# Altium schematic sheet Top-Sheet.SchDoc
size A4; SheetNumber: 1; SheetTotal: 6
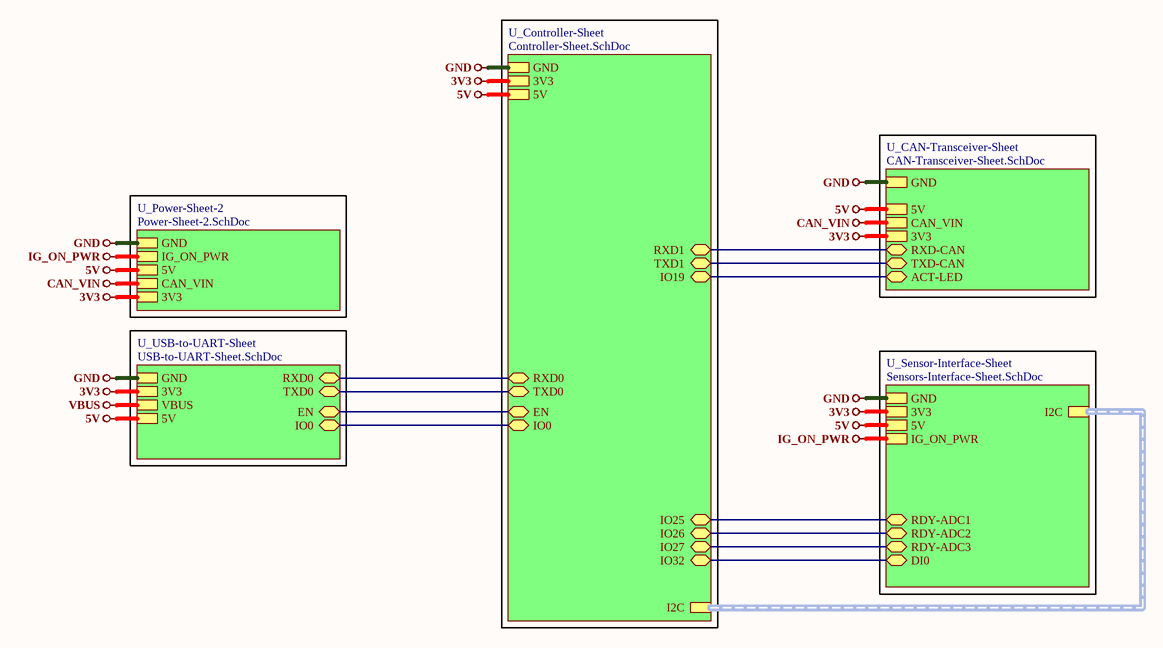
[diagram p0: Top-Sheet.SchDoc]

## Sub-sheets
U_CAN-Transceiver-Sheet = CAN-Transceiver-Sheet.SchDoc: GND, 3V3, CAN_VIN, RXD-CAN (bidir), TXD-CAN (bidir), ACT-LED (bidir), 5V
U_Controller-Sheet = Controller-Sheet.SchDoc: I2C (harness I2C), GND, 3V3, TXD0 (bidir), RXD0 (bidir), EN (bidir), IO0 (bidir), TXD1 (bidir), RXD1 (bidir), IO25 (bidir), IO26 (bidir), IO27 (bidir), IO19 (bidir), IO32 (bidir), 5V
U_Power-Sheet-2 = Power-Sheet-2.SchDoc: 5V, GND, 3V3, CAN_VIN, IG_ON_PWR
U_Sensor-Interface-Sheet = Sensors-Interface-Sheet.SchDoc: I2C (harness I2C), GND, 3V3, RDY-ADC1 (bidir), RDY-ADC2 (bidir), RDY-ADC3 (bidir), 5V, DI0 (bidir), IG_ON_PWR
U_USB-to-UART-Sheet = USB-to-UART-Sheet.SchDoc: GND, 3V3, EN (bidir), IO0 (bidir), VBUS, RXD0 (bidir), TXD0 (bidir), 5V

## Nets
3V3: sheet U_Power-Sheet-2/3V3, sheet U_USB-to-UART-Sheet/3V3, sheet U_Controller-Sheet/3V3, sheet U_CAN-Transceiver-Sheet/3V3, sheet U_Sensor-Interface-Sheet/3V3
5V: sheet U_Power-Sheet-2/5V, sheet U_USB-to-UART-Sheet/5V, sheet U_Controller-Sheet/5V, sheet U_CAN-Transceiver-Sheet/5V, sheet U_Sensor-Interface-Sheet/5V
CAN_VIN: sheet U_Power-Sheet-2/CAN_VIN, sheet U_CAN-Transceiver-Sheet/CAN_VIN
GND: sheet U_Power-Sheet-2/GND, sheet U_USB-to-UART-Sheet/GND, sheet U_Controller-Sheet/GND, sheet U_CAN-Transceiver-Sheet/GND, sheet U_Sensor-Interface-Sheet/GND
IG_ON_PWR: sheet U_Power-Sheet-2/IG_ON_PWR, sheet U_Sensor-Interface-Sheet/IG_ON_PWR
VBUS: sheet U_USB-to-UART-Sheet/VBUS
(unnamed): sheet U_USB-to-UART-Sheet/EN, sheet U_Controller-Sheet/EN
(unnamed): sheet U_USB-to-UART-Sheet/IO0, sheet U_Controller-Sheet/IO0
(unnamed): sheet U_USB-to-UART-Sheet/RXD0, sheet U_Controller-Sheet/RXD0
(unnamed): sheet U_USB-to-UART-Sheet/TXD0, sheet U_Controller-Sheet/TXD0
(unnamed): sheet U_Controller-Sheet/TXD1, sheet U_CAN-Transceiver-Sheet/TXD-CAN
(unnamed): sheet U_Controller-Sheet/RXD1, sheet U_CAN-Transceiver-Sheet/RXD-CAN
(unnamed): sheet U_Controller-Sheet/IO25, sheet U_Sensor-Interface-Sheet/RDY-ADC1
(unnamed): sheet U_Controller-Sheet/IO26, sheet U_Sensor-Interface-Sheet/RDY-ADC2
(unnamed): sheet U_Controller-Sheet/IO27, sheet U_Sensor-Interface-Sheet/RDY-ADC3
(unnamed): sheet U_Controller-Sheet/IO19, sheet U_CAN-Transceiver-Sheet/ACT-LED
(unnamed): sheet U_Controller-Sheet/IO32, sheet U_Sensor-Interface-Sheet/DI0

## Buses and harness runs
harness sheet U_Controller-Sheet/I2C = sheet U_Sensor-Interface-Sheet/I2C

## Notes on the sheet
- File:
- Title:
- Date:
- Page
- Num:
- Total:
- Drawn By: Huzaifa Ali